# Altium schematic sheet mmicronode_nicenano.SchDoc
size A3; SheetNumber: 1; SheetTotal: 1
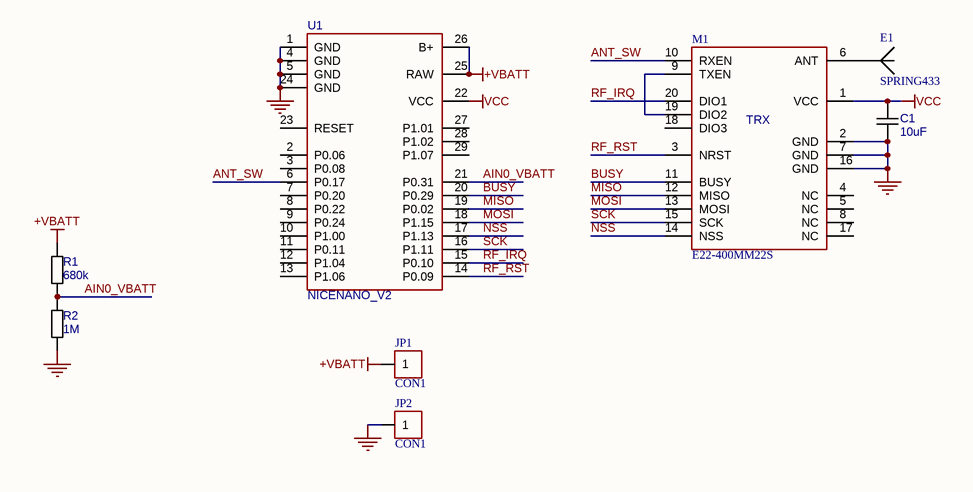
[diagram p0: mmicronode_nicenano.SchDoc]

## Parts
C1  10uF  [C-0805]
E1  SPRING433  [SPRING433]
JP1  CON1  [PAD1]
JP2  CON1  [PAD1]
M1  E22-400MM22S  [E290-XXXMM20S]
R1  680k  [R-0603]
R2  1M  [R-0603]
U1  NICENANO_V2  [NICENANO_CUTTED]

## Nets
+VBATT: JP1.1 R1.2 U1.25(RAW) U1.26(B+)
GND: C1.2 JP2.1 M1.2(GND) M1.7(GND) M1.16(GND) R2.1 U1.1(GND) U1.4(GND) U1.5(GND) U1.24(GND)
VCC: C1.1 M1.1(VCC) U1.22(VCC)
AIN0_VBATT: R1.1 R2.2 U1.21(P0.31)
ANT_SW: M1.10(RXEN) U1.6(P0.17)
BUSY: M1.11(BUSY) U1.20(P0.29)
MISO: M1.12(MISO) U1.19(P0.02)
MOSI: M1.13(MOSI) U1.18(P1.15)
NSS: M1.14(NSS) U1.17(P1.13)
RF_IRQ: M1.20(DIO1) U1.15(P0.10)
RF_RST: M1.3(NRST) U1.14(P0.09)
SCK: M1.15(SCK) U1.16(P1.11)
NetE1_1: E1.1 M1.6(ANT)
NetM1_9: M1.9(TXEN) M1.19(DIO2)

Not connected (* = marked no-connect by the designer): M1 4(NC) 5(NC) 8(NC) 17(NC) 18(DIO3); U1 2(P0.06) 3(P0.08) 7(P0.20) 8(P0.22) 9(P0.24) 10(P1.00) 11(P0.11) 12(P1.04) 13(P1.06) 23(RESET) 27(P1.01) 28(P1.02) 29(P1.07)

## Notes on the sheet
- (in symbol E22-400MM22S) TRX

## Library data of the parts
C1 = CAPN: Voltage: 50V; Точність/група: NP0; Вид: Конденсатор
E1 = ANT: Примітки: Пряма; Вид: Антена
JP1 JP2 = CON1: Вид: Роз'єм; *: *
R1 R2 = RES: Точність/група: 5%; Вид: Резистор
U1 = NICENANO_V2: Вид: Мікросхема